# Altium schematic sheet Sheet1.SchDoc
size C; SheetNumber: 1; SheetTotal: 1
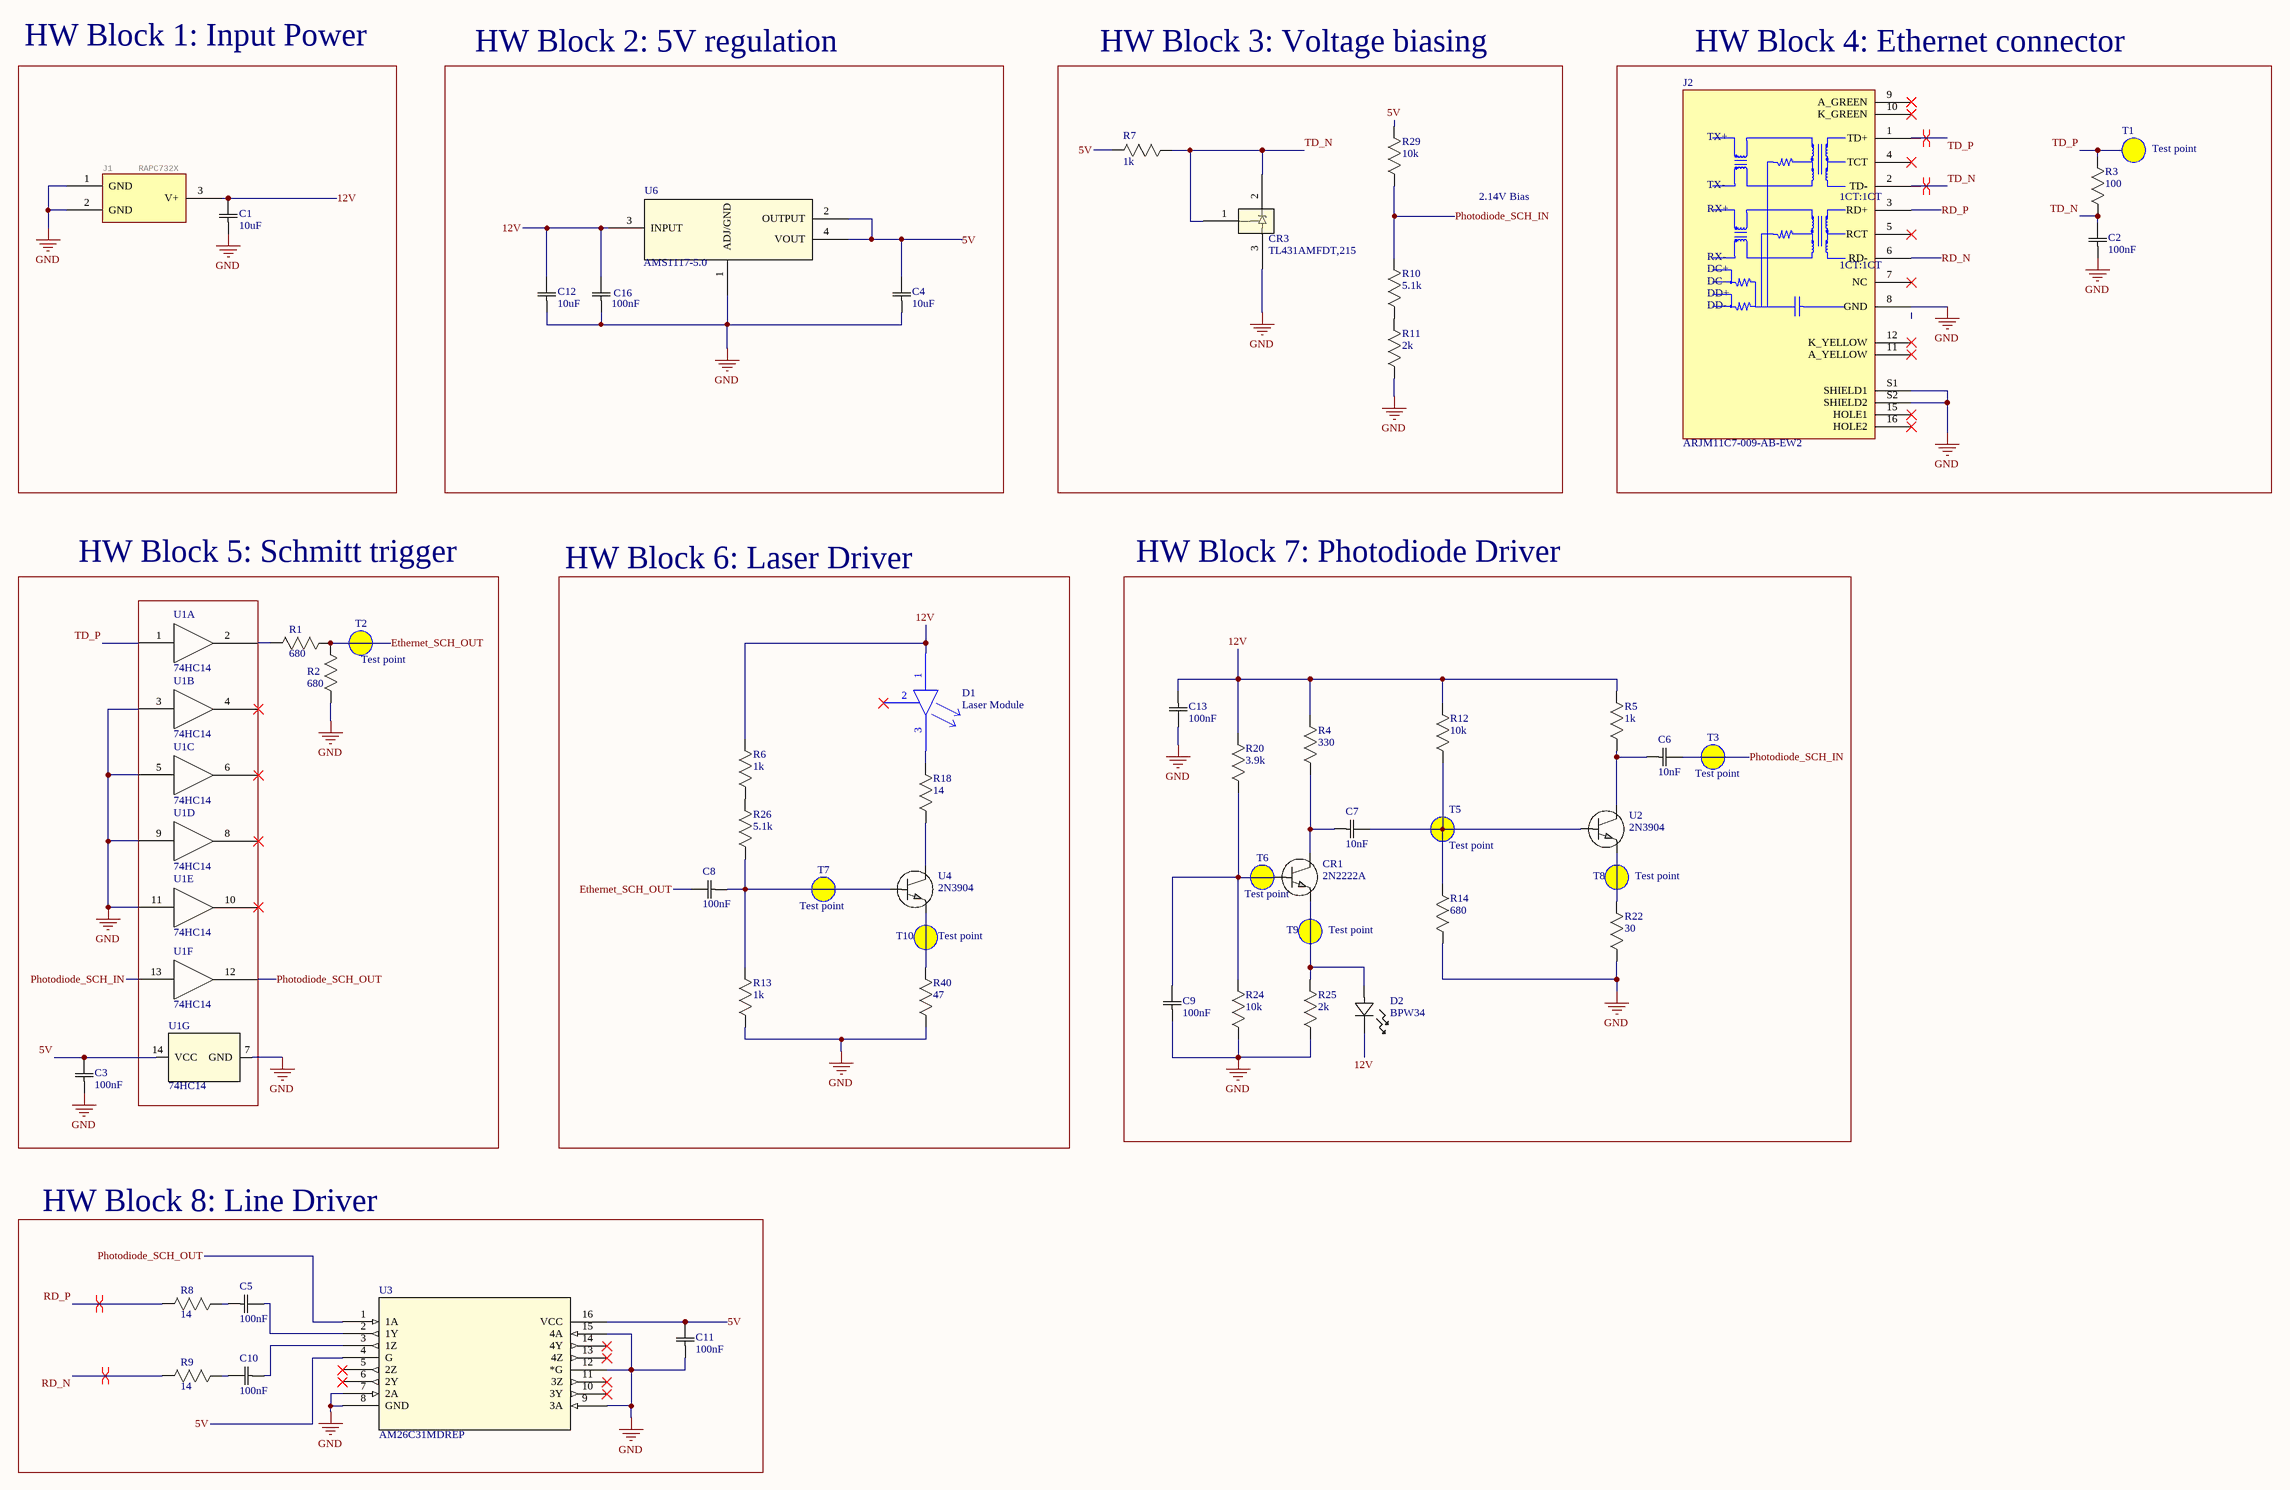
[diagram p0: Sheet1.SchDoc]

## Parts
C1  10uF  [CAP_UMK316ABJ475KLHT_TAY]
C2  100nF  [CAP_0805J_AVX]
C3  100nF  [CAP_0805J_AVX]
C4  10uF  [CAP_TRJ-A-1206_AVX]
C5  100nF  [CAP_0805J_AVX]
C6  10nF  [CAP_0805J_AVX]
C7  10nF  [CAP_0805J_AVX]
C8  100nF  [CAP_0805J_AVX]
C9  100nF  [CAP_0805J_AVX]
C10  100nF  [CAP_0805J_AVX]
C11  100nF  [CAP_0805J_AVX]
C12  10uF  [CAP_UMK316ABJ475KLHT_TAY]
C13  100nF  [CAP_0805J_AVX]
C16  100nF  [CAP_0805J_AVX]
CR1  2N2222A  [TO-18_STM]
CR3  TL431AMFDT,215  [TL431AMFDT,215_NEX]
D1  Laser Module  [5V Laser Module]
D2  BPW34  [BPW34]
J1  RAPC732X  [RAPC732X]
J2  ARJM11C7-009-AB-EW2  [ARJM11C7009ABEW2]
R1  680  [RES_CRGCQ0805_TEC]
R2  680  [RES_CRGCQ0805_TEC]
R3  100  [RES_CRGCQ0805_TEC]
R4  330  [RES_CRGP1206F10R_TEC]
R5  1k  [RES_CRGCQ0805_TEC]
R6  1k  [RES_CRGCQ0805_TEC]
R7  1k  [RES_CRGP1206F10R_TEC]
R8  14  [RES_CRGCQ0805_TEC]
R9  14  [RES_CRGCQ0805_TEC]
R10  5.1k  [RES_CRGCQ0805_TEC]
R11  2k  [RES_CRGCQ0805_TEC]
R12  10k  [RES_CRGCQ0805_TEC]
R13  1k  [RES_CRGCQ0805_TEC]
R14  680  [RES_CRGCQ0805_TEC]
R18  14  [RES_CRGP1206F10R_TEC]
R20  3.9k  [RES_CRGCQ0805_TEC]
R22  30  [RES_CRGCQ0805_TEC]
R24  10k  [RES_CRGCQ0805_TEC]
R25  2k  [RES_CRGCQ0805_TEC]
R26  5.1k  [RES_CRGCQ0805_TEC]
R29  10k  [RES_CRGCQ0805_TEC]
R40  47  [RES_CRGCQ0805_TEC]
T1  Test point  [Test point]
T2  Test point  [Test point]
T3  Test point  [Test point]
T5  Test point  [Test point]
T6  Test point  [Test point]
T7  Test point  [Test point]
T8  Test point  [Test point]
T9  Test point  [Test point]
T10  Test point  [Test point]
U1  74HC14  [74HC14]  (parts A,B,C,D,E,F,G of 7)
U2  2N3904  [TO-92_2]
U3  AM26C31MDREP  [D16]
U4  2N3904  [TO-92_2]
U6  AMS1117-5.0  [SOT_AMS1117-2.5_AMS]

## Blocks framed on the sheet
HW Block 1: Input Power: C1 J1
HW Block 2: 5V regulation: C4 C12 C16 U6
HW Block 3: Voltage biasing: CR3 R7 R10 R11 R29
HW Block 4: Ethernet connector: C2 J2 R3 T1
HW Block 5: Schmitt trigger: C3 R1 R2 T2 U1
HW Block 6: Laser Driver: C8 D1 R6 R13 R18 R26 R40 T7 T10 U4
HW Block 7: Photodiode Driver: C6 C7 C9 C13 CR1 D2 R4 R5 R12 R14 R20 R22 R24 R25 T3 T5 T6 T8 T9 U2
HW Block 8: Line Driver: C5 C10 C11 R8 R9 U3

## Nets
GND: C1.1 C2.1 C3.1 C4.1 C9.1 C11.1 C12.1 C13.2 C16.1 CR3.3 J1.1(GND) J1.2(GND) J2.8(GND) J2.S1(SHIELD1) J2.S2(SHIELD2) R2.1 R11.1 R13.1 R14.2 R22.1 R24.1 R25.1 R40.1 U1.3(A) U1.5(A) U1.7(GND) U1.9(A) U1.11(A) U3.7(2A) U3.8(GND) U3.9(3A) U3.12(*G) U3.15(4A) U6.1(ADJ/GND)
5V: C3.2 C4.2 C11.2 R7.2 R29.2 U1.14(VCC) U3.4(G) U3.16(VCC) U6.2(OUTPUT) U6.4(VOUT)
12V: C1.2 C12.2 C13.1 C16.2 D1.1(PWR) D2.1 J1.3(V+) R4.2 R5.2 R6.2 R12.2 R20.2 U6.3(INPUT)
Ethernet_SCH_OUT: C8.2 R1.1 R2.2
Photodiode_SCH_IN: C6.2 R10.2 R29.1 U1.13(A)
Photodiode_SCH_OUT: U1.12(Y) U3.1(1A)
RD_N: J2.6(RD-) R9.2
RD_P: J2.3(RD+) R8.2
TD_N: C2.2 CR3.1 CR3.2 J2.2(TD-) R3.1 R7.1
TD_P: J2.1(TD+) R3.2 U1.1(A)
NetC5_1: C5.1 R8.1
NetC5_2: C5.2 U3.2(1Y)
NetC6_1: C6.1 R5.1 U2.3(C)
NetC7_1: C7.1 CR1.2(C) R4.1
NetC7_2: C7.2 R12.1 R14.1 U2.2(B)
NetC8_1: C8.1 R13.2 R26.1 U4.2(B)
NetC9_2: C9.2 CR1.1(B) R20.1 R24.2
NetC10_1: C10.1 U3.3(1Z)
NetC10_2: C10.2 R9.1
NetCR1_3: CR1.3(E) D2.2 R25.2
NetD1_3: D1.3(GND) R18.2
NetR1_2: R1.2 U1.2(Y)
NetR6_1: R6.1 R26.2
NetR10_1: R10.1 R11.2
NetR18_1: R18.1 U4.3(C)
NetR22_2: R22.2 U2.1(E)
NetR40_2: R40.2 U4.1(E)

Not connected (* = marked no-connect by the designer): D1 2(NC)*; J2 4(TCT)* 5(RCT)* 7(NC)* 9(A_GREEN)* 10(K_GREEN)* 11(A_YELLOW)* 12(K_YELLOW)* 15(HOLE1)* 16(HOLE2)*; U1 4(Y)* 6(Y)* 8(Y)* 10(Y)*; U3 5(2Z)* 6(2Y)* 10(3Y)* 11(3Z)* 13(4Z)* 14(4Y)*

## Layout directives
differential pair: RD_N, RD_P, TD_N, TD_P

## Notes on the sheet
- 2.14V Bias
- (in symbol ARJM11C7-009-AB-EW2) TX+; TX-; 1CT:1CT; RX+; RX-; DC+; DC-; DD+; DD-

## Library data of the parts
C1 C12 = 1206 cap: No Description Available; Manufacturer_Name: TAIYO YUDEN; Manufacturer_Part_Number: UMK316B7105KLHT; Copyright: Copyright (C) 2026 Ultra Librarian. All rights reserved.
C2 C3 C5-C11 C13 C16 = 0805 cap: Description; Manufacturer_Name: KYOCERA AVX; Manufacturer_Part_Number: 08051A8R2CAT2A; Copyright: Copyright (C) 2026 Ultra Librarian. All rights reserved.
C4 = 10uF case-A 3216 cap: Description; Manufacturer_Name: KYOCERA AVX; Manufacturer_Part_Number: TRJA224K035R6000; Copyright: Copyright (C) 2026 Ultra Librarian. All rights reserved.
CR1 = 2N2222A: Description; Manufacturer_Name: STMicroelectronics; Copyright: Copyright (C) 2025 Ultra Librarian. All rights reserved.; Manufacturer_Part_Number: 2N2222A
CR3 = TL431AMFDT,215: Description; Manufacturer_Name: Nexperia; Copyright: Copyright (C) 2025 Ultra Librarian. All rights reserved.; Manufacturer_Part_Number: TL431AMFDT,215; RefDes: RefDes; Type: Type
D1 = 5V Laser Module
J1 = RAPC732X: Manufacturer_Name: Switchcraft; GateName_1: G$1; SymbolName_1: RAPC732X; LibraryName: RAPC732X; DeviceSetName: RAPC732X; Package: RAPC732X; Manufacturer_Part_Number: RAPC732X; Mouser_Part_Number: 502-RAPC732X; Mouser_Price-Stock: https://www.mouser.co.uk/ProductDetail/Switchcraft/RAPC732X?qs=mcPJWgAPNrf44q5B71nLHg%3D%3D; Arrow_Part_Number: RAPC732X; Arrow_Price-Stock: https://www.arrow.com/en/products/rapc732x/switchcraft?region=nac; Height: 11mm; ComponentLink1Description: Supplier; ComponentLink1URL: https://makerselectronics.com/product/dc-power-jack-female-socket-connector-5-5mmx2-1mm/
J2 = ARJM11C7-009-AB-EW2: Modular Connector, 100 Base-T, RJ45 Jack, 1 x 1 (Port), 8P8C, Through Hole Mount; Manufacturer: Abracon LLC; Inductance: 350µH; Number of Ports: 1; Plating Thickness: 152.4nm; Row Spacing: 2.54mm; Manufacturer Part Number: ARJM11C7-009-AB-EW2; Mounting Type: Through Hole; RoHS: Compliant; Category: Modular / Ethernet Connectors; Stock 1: 4998; Pricing 1: 1=3.05, 10=2.592, 25=2.4292, 50=2.3132, 100=2.2026, 250=2.06468, 500=1.96614, 2000=1.78304, 4000=1.76355 (USD); China RoHS: Compliant; Contact Gender: Female; Contact Plating: Gold; Height: 13.8mm; Length: 21.3mm; Lifecycle Status: Production; Max Operating Temperature: 85°C; Min Operating Temperature: -40°C; Mount: Through Hole; Number of Pins: 8; Number of Rows: 2; REACH SVHC: No; Shell Finish: Nickel; Shell Material: Brass; Terminal Pitch: 2.54mm; Width: 15.9mm; ComponentLink1URL: https://datasheet.octopart.com:443/ARJM11C7-009-AB-EW2-Abracon-datasheet-182207866.pdf?src-supplier=IHS; ComponentLink1Description: https://datasheet.octopart.com:443/ARJM11C7-009-AB-EW2-Abracon-datasheet-182207866.pdf?src-supplier=IHS; ComponentLink2URL: https://datasheet.octopart.com:443/ARJM11C7-009-AB-EW2-Abracon-datasheet-97040553.pdf?src-supplier=Electro+Sonic; ComponentLink2Description: https://datasheet.octopart.com:443/ARJM11C7-009-AB-EW2-Abracon-datasheet-97040553.pdf?src-supplier=Electro+Sonic; ComponentLink3URL: https://datasheet.octopart.com:443/ARJM11C7-009-AB-EW2-Abracon-datasheet-115391515.pdf?src-supplier=Abracon+SCT; ComponentLink3Description: https://datasheet.octopart.com:443/ARJM11C7-009-AB-EW2-Abracon-datasheet-115391515.pdf?src-supplier=Abracon+SCT; ComponentLink4URL: http://sigma.octopart.com:80/conflict_mineral_statement/Abracon-company-27.pdf?src-supplier=Compliance+Statements; ComponentLink4Description: http://sigma.octopart.com:80/conflict_mineral_statement/Abracon-company-27.pdf?src-supplier=Compliance+Statements; Supplier 1: DigiKey; Supplier Part Number 1: 535-14159-ND
R1-R3 R5 R6 R8-R14 R20 R22 R24-R26 R29 R40 = 0805 resistor: CRGCQ 0805 120K 1%; Manufacturer_Name: TE Connectivity; Manufacturer_Part_Number: CRGCQ0805F120K; Copyright: Copyright (C) 2026 Ultra Librarian. All rights reserved.
  R8 R9: ComponentLink1Description: Supplier; ComponentLink1URL: https://ampere-electronics.com/product/0ohm-smd-resistor-0-125w-0805-2012m/
R4 R7 R18 = 1206 resistor: CRGP 1206 10R 1%; Manufacturer_Name: TE Connectivity; Manufacturer_Part_Number: CRGP1206F10R; Type: Chip Resistor - Surface Mount; Copyright: Copyright (C) 2025 Ultra Librarian. All rights reserved.
U1 = 74HC14: Description; Manufacturer_Name: Texas Instruments; Copyright: Copyright (C) 2026 Ultra Librarian. All rights reserved.; Manufacturer_Part_Number: 74HC14
U2 U4 = 2N3904: Description; Manufacturer_Name: onsemi; Copyright: Copyright (C) 2025 Ultra Librarian. All rights reserved.; Manufacturer_Part_Number: 2N3904; RefDes: RefDes; Type: Type
U3 = AM26C31MDREP: Enhanced Product quadruple differential line driver 16-SOIC -55 to 125; Manufacturer_Name: Texas Instruments; Copyright: Copyright (C) 2025 Ultra Librarian. All rights reserved.; Manufacturer_Part_Number: AM26C31MDREP; RefDes: RefDes; Type: Type
U6 = AMS1117-5.0: Description; Manufacturer_Name: ams OSRAM; Copyright: Copyright (C) 2025 Ultra Librarian. All rights reserved.; Manufacturer_Part_Number: AMS1117-5.0; RefDes: RefDes; Type: Type